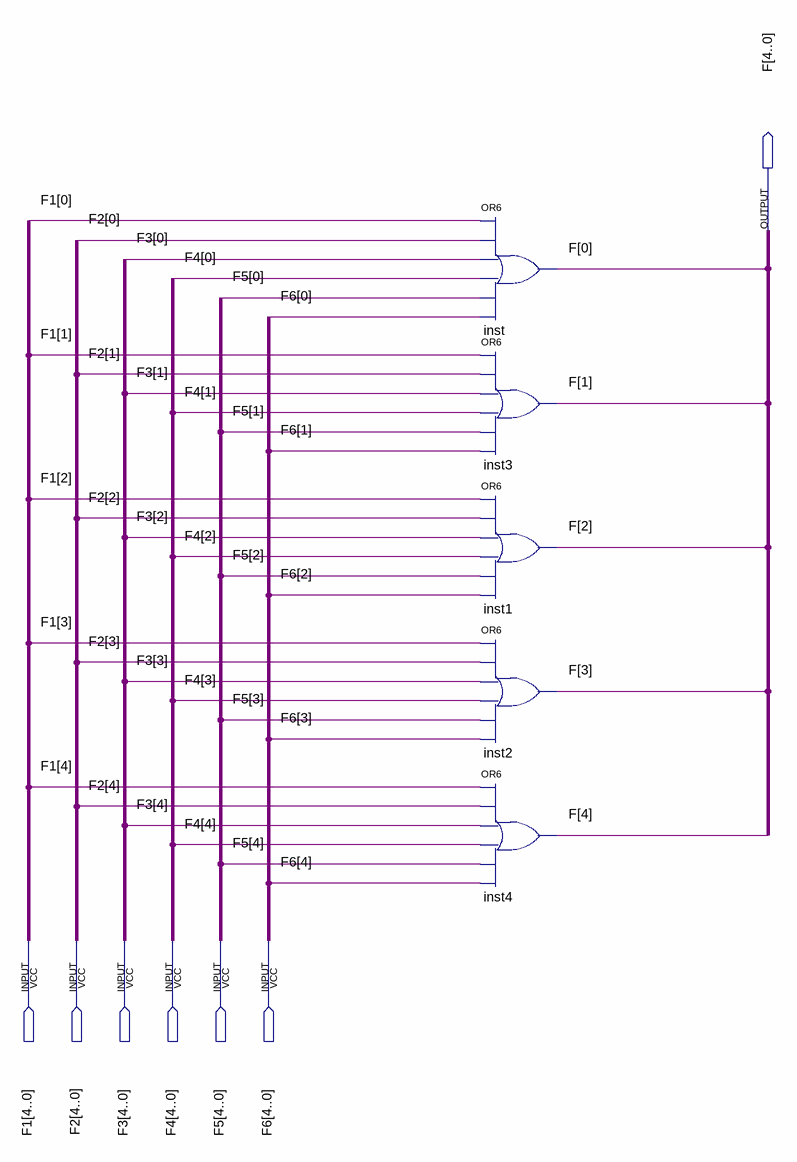
[diagram p0: schematic sheet]
// Quartus schematic or_selection_5bits.bdf as structural Verilog: 5 symbols, 7 pins
module or_selection_5bits (
  input  [4:0] F1,
  input  [4:0] F2,
  input  [4:0] F3,
  input  [4:0] F4,
  input  [4:0] F5,
  input  [4:0] F6,
  output [4:0] F
);

  or inst (F[0], F1[0], F2[0], F3[0], F4[0], F5[0], F6[0]);
  or inst3 (F[1], F1[1], F2[1], F3[1], F4[1], F5[1], F6[1]);
  or inst1 (F[2], F1[2], F2[2], F3[2], F4[2], F5[2], F6[2]);
  or inst2 (F[3], F1[3], F2[3], F3[3], F4[3], F5[3], F6[3]);
  or inst4 (F[4], F1[4], F2[4], F3[4], F4[4], F5[4], F6[4]);
endmodule
